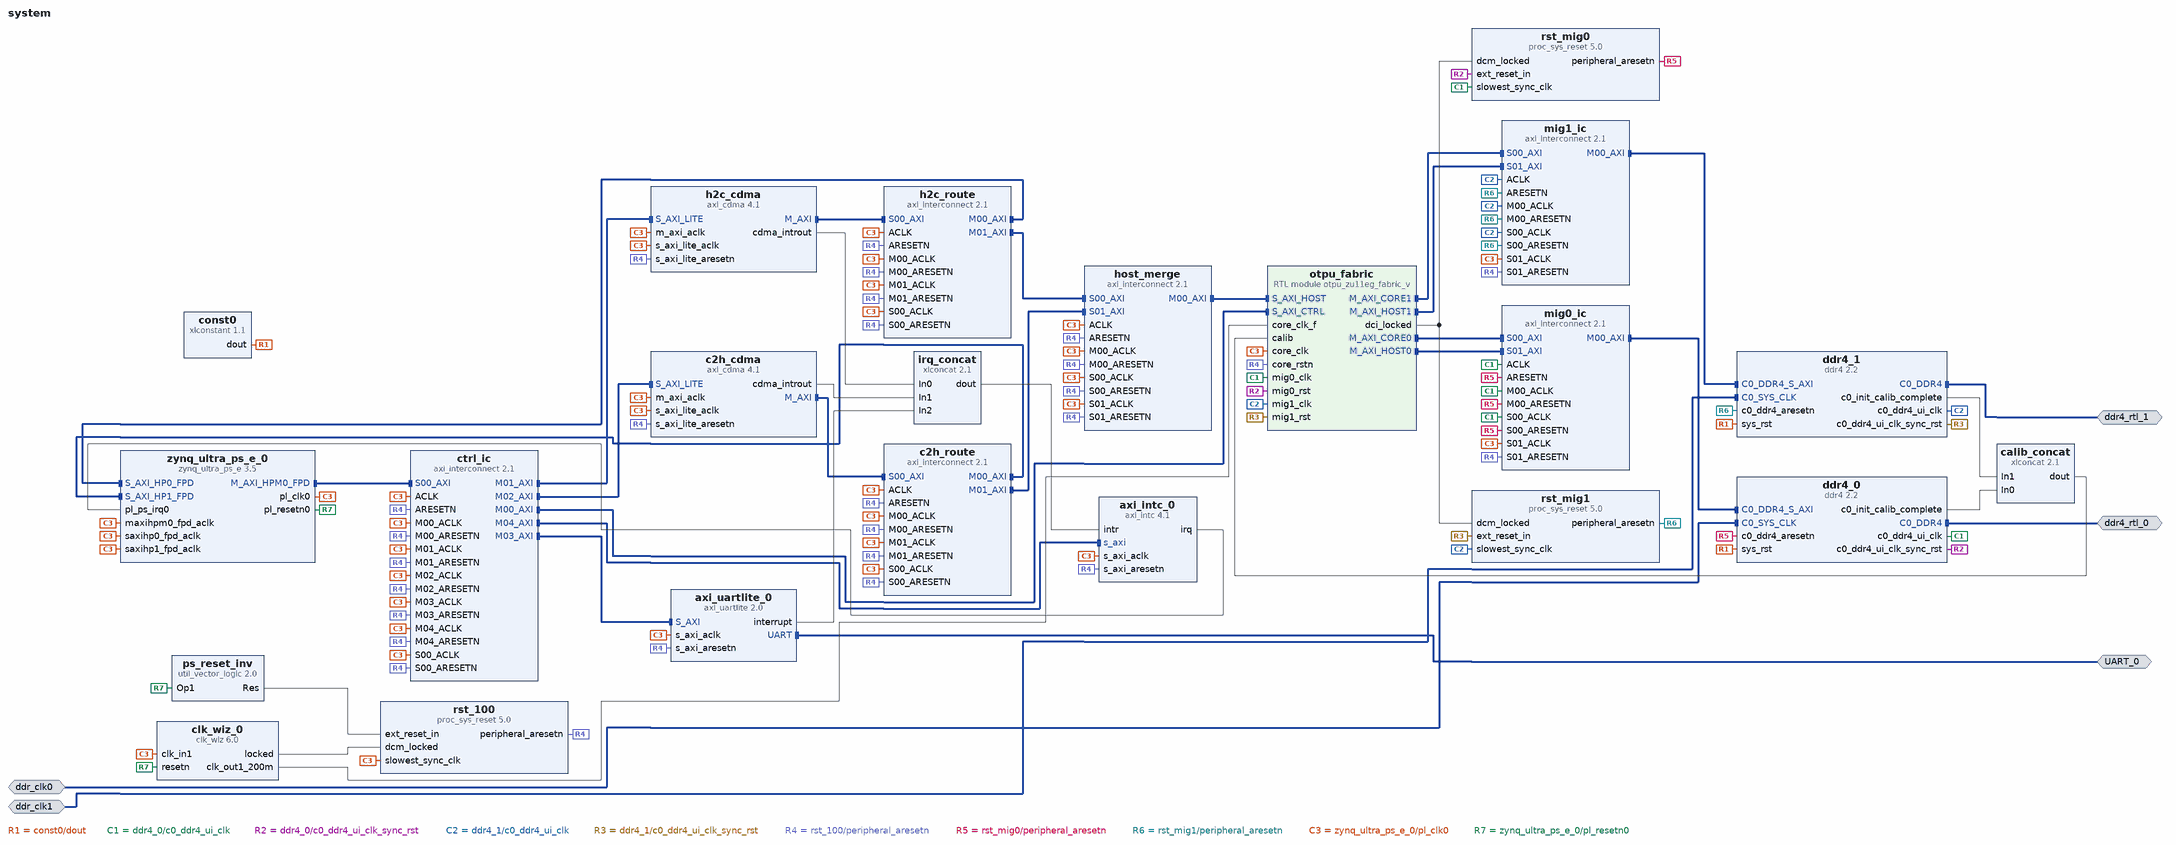
[diagram p0: block diagram of the top level]
# Vivado block design system, xczu11eg-ffvc1760-2-i, Vivado 2025.2
create_bd_design system

create_bd_intf_port -mode Slave -vlnv xilinx.com:interface:diff_clock_rtl:1.0 ddr_clk0
set_property -dict {CONFIG.FREQ_HZ 100000000} [get_bd_intf_ports ddr_clk0]
create_bd_intf_port -mode Slave -vlnv xilinx.com:interface:diff_clock_rtl:1.0 ddr_clk1
set_property -dict {CONFIG.FREQ_HZ 100000000} [get_bd_intf_ports ddr_clk1]
create_bd_intf_port -mode Master -vlnv xilinx.com:interface:ddr4_rtl:1.0 ddr4_rtl_0
create_bd_intf_port -mode Master -vlnv xilinx.com:interface:ddr4_rtl:1.0 ddr4_rtl_1
create_bd_intf_port -mode Master -vlnv xilinx.com:interface:uart_rtl:1.0 UART_0

create_bd_cell -type ip -vlnv xilinx.com:ip:zynq_ultra_ps_e:3.5 zynq_ultra_ps_e_0
set_property -dict [list \
  CONFIG.PSU__CRF_APB__DDR_CTRL__FREQMHZ 1200 \
  CONFIG.PSU__CRL_APB__GEM3_REF_CTRL__FREQMHZ 125 \
  CONFIG.PSU__CRL_APB__GEM3_REF_CTRL__SRCSEL IOPLL \
  CONFIG.PSU__CRL_APB__PL0_REF_CTRL__FREQMHZ 100 \
  CONFIG.PSU__CRL_APB__PL0_REF_CTRL__SRCSEL IOPLL \
  CONFIG.PSU__DDRC__BUS_WIDTH {64 Bit} \
  CONFIG.PSU__DDRC__DEVICE_CAPACITY {16384 MBits} \
  CONFIG.PSU__DDRC__DRAM_WIDTH {16 Bits} \
  CONFIG.PSU__DDRC__ECC Disabled \
  CONFIG.PSU__DDRC__MEMORY_TYPE {DDR 4} \
  CONFIG.PSU__DDRC__SPEED_BIN DDR4_2400T \
  CONFIG.PSU__DDR_HIGH_ADDRESS_GUI_ENABLE 1 \
  CONFIG.PSU__DDR__INTERFACE__FREQMHZ 600.000 \
  CONFIG.PSU__DLL__ISUSED 1 \
  CONFIG.PSU__ENET3__FIFO__ENABLE 0 \
  CONFIG.PSU__ENET3__GRP_MDIO__ENABLE 1 \
  CONFIG.PSU__ENET3__GRP_MDIO__IO {MIO 76 .. 77} \
  CONFIG.PSU__ENET3__PERIPHERAL__ENABLE 1 \
  CONFIG.PSU__ENET3__PERIPHERAL__IO {MIO 64 .. 75} \
  CONFIG.PSU__ENET3__PTP__ENABLE 0 \
  CONFIG.PSU__ENET3__TSU__ENABLE 0 \
  CONFIG.PSU__FPGA_PL0_ENABLE 1 \
  CONFIG.PSU__GEM3_COHERENCY 0 \
  CONFIG.PSU__GEM3_ROUTE_THROUGH_FPD 0 \
  CONFIG.PSU__GEM__TSU__ENABLE 0 \
  CONFIG.PSU__MAXIGP0__DATA_WIDTH 128 \
  CONFIG.PSU__PSS_REF_CLK__FREQMHZ 33.333333 \
  CONFIG.PSU__QSPI_COHERENCY 0 \
  CONFIG.PSU__QSPI_ROUTE_THROUGH_FPD 0 \
  CONFIG.PSU__QSPI__GRP_FBCLK__ENABLE 1 \
  CONFIG.PSU__QSPI__GRP_FBCLK__IO {MIO 6} \
  CONFIG.PSU__QSPI__PERIPHERAL__DATA_MODE x4 \
  CONFIG.PSU__QSPI__PERIPHERAL__ENABLE 1 \
  CONFIG.PSU__QSPI__PERIPHERAL__IO {MIO 0 .. 12} \
  CONFIG.PSU__QSPI__PERIPHERAL__MODE {Dual Parallel} \
  CONFIG.PSU__SD1_COHERENCY 0 \
  CONFIG.PSU__SD1_ROUTE_THROUGH_FPD 0 \
  CONFIG.PSU__SD1__CLK_200_SDR_OTAP_DLY 0x3 \
  CONFIG.PSU__SD1__CLK_50_DDR_ITAP_DLY 0x12 \
  CONFIG.PSU__SD1__CLK_50_DDR_OTAP_DLY 0x6 \
  CONFIG.PSU__SD1__CLK_50_SDR_ITAP_DLY 0x15 \
  CONFIG.PSU__SD1__CLK_50_SDR_OTAP_DLY 0x6 \
  CONFIG.PSU__SD1__DATA_TRANSFER_MODE 8Bit \
  CONFIG.PSU__SD1__GRP_POW__ENABLE 0 \
  CONFIG.PSU__SD1__PERIPHERAL__ENABLE 1 \
  CONFIG.PSU__SD1__PERIPHERAL__IO {MIO 39 .. 51} \
  CONFIG.PSU__SD1__SLOT_TYPE eMMC \
  CONFIG.PSU__TSU__BUFG_PORT_PAIR 0 \
  CONFIG.PSU__UART0__BAUD_RATE 115200 \
  CONFIG.PSU__UART0__MODEM__ENABLE 0 \
  CONFIG.PSU__UART0__PERIPHERAL__ENABLE 1 \
  CONFIG.PSU__UART0__PERIPHERAL__IO {MIO 34 .. 35} \
  CONFIG.PSU__USE__IRQ0 1 \
  CONFIG.PSU__USE__M_AXI_GP0 1 \
  CONFIG.PSU__USE__M_AXI_GP1 0 \
  CONFIG.PSU__USE__M_AXI_GP2 0 \
  CONFIG.PSU__USE__S_AXI_GP2 1 \
  CONFIG.PSU__USE__S_AXI_GP3 1 \
] [get_bd_cells zynq_ultra_ps_e_0]
# 54 more settings of zynq_ultra_ps_e_0 are not shown: defaults, MIO pin electricals, DDR timing, and values the tool derives
create_bd_cell -type ip -vlnv xilinx.com:ip:ddr4:2.2 ddr4_0
set_property -dict [list \
  CONFIG.C0.DDR4_AxiAddressWidth 32 \
  CONFIG.C0.DDR4_AxiDataWidth 512 \
  CONFIG.C0.DDR4_AxiIDWidth 4 \
  CONFIG.C0.DDR4_CasLatency 16 \
  CONFIG.C0.DDR4_CasWriteLatency 12 \
  CONFIG.C0.DDR4_DataWidth 64 \
  CONFIG.C0.DDR4_InputClockPeriod 9996 \
  CONFIG.C0.DDR4_MemoryPart MT40A512M16HA-083E \
  CONFIG.C0.DDR4_TimePeriod 833 \
] [get_bd_cells ddr4_0]
create_bd_cell -type ip -vlnv xilinx.com:ip:ddr4:2.2 ddr4_1
set_property -dict [list \
  CONFIG.C0.DDR4_AxiAddressWidth 32 \
  CONFIG.C0.DDR4_AxiDataWidth 512 \
  CONFIG.C0.DDR4_AxiIDWidth 4 \
  CONFIG.C0.DDR4_CasLatency 16 \
  CONFIG.C0.DDR4_CasWriteLatency 12 \
  CONFIG.C0.DDR4_DataWidth 64 \
  CONFIG.C0.DDR4_InputClockPeriod 9996 \
  CONFIG.C0.DDR4_MemoryPart MT40A512M16HA-083E \
  CONFIG.C0.DDR4_TimePeriod 833 \
] [get_bd_cells ddr4_1]
create_bd_cell -type module -reference otpu_zu11eg_fabric_v otpu_fabric
create_bd_cell -type ip -vlnv xilinx.com:ip:axi_cdma:4.1 h2c_cdma
set_property -dict [list \
  CONFIG.C_ADDR_WIDTH 64 \
  CONFIG.C_INCLUDE_SG 0 \
  CONFIG.C_M_AXI_DATA_WIDTH 128 \
  CONFIG.C_M_AXI_MAX_BURST_LEN 256 \
] [get_bd_cells h2c_cdma]
create_bd_cell -type ip -vlnv xilinx.com:ip:axi_cdma:4.1 c2h_cdma
set_property -dict [list \
  CONFIG.C_ADDR_WIDTH 64 \
  CONFIG.C_INCLUDE_SG 0 \
  CONFIG.C_M_AXI_DATA_WIDTH 128 \
  CONFIG.C_M_AXI_MAX_BURST_LEN 256 \
] [get_bd_cells c2h_cdma]
create_bd_cell -type ip -vlnv xilinx.com:ip:axi_uartlite:2.0 axi_uartlite_0
set_property -dict [list \
  CONFIG.C_BAUDRATE 115200 \
  CONFIG.C_DATA_BITS 8 \
  CONFIG.C_S_AXI_ACLK_FREQ_HZ 100000000 \
  CONFIG.C_USE_PARITY 0 \
] [get_bd_cells axi_uartlite_0]
create_bd_cell -type ip -vlnv xilinx.com:ip:clk_wiz:6.0 clk_wiz_0
set_property -dict [list \
  CONFIG.CLKIN1_JITTER_PS 100.0 \
  CONFIG.CLKOUT1_REQUESTED_OUT_FREQ 200.000 \
  CONFIG.CLKOUT1_REQUESTED_PHASE 0.000 \
  CONFIG.CLKOUT1_USED true \
  CONFIG.CLKOUT2_USED false \
  CONFIG.CLKOUT3_USED false \
  CONFIG.CLKOUT4_USED false \
  CONFIG.CLKOUT5_USED false \
  CONFIG.CLKOUT6_USED false \
  CONFIG.CLKOUT7_USED false \
  CONFIG.CLK_OUT1_PORT clk_out1_200m \
  CONFIG.NUM_OUT_CLKS 1 \
  CONFIG.PRIMITIVE MMCM \
  CONFIG.PRIM_IN_FREQ 100.000 \
  CONFIG.PRIM_SOURCE Global_buffer \
  CONFIG.RESET_PORT resetn \
  CONFIG.RESET_TYPE ACTIVE_LOW \
  CONFIG.USE_LOCKED true \
  CONFIG.USE_RESET true \
] [get_bd_cells clk_wiz_0]
create_bd_cell -type ip -vlnv xilinx.com:ip:axi_intc:4.1 axi_intc_0
set_property -dict {CONFIG.C_IRQ_CONNECTION 1} [get_bd_cells axi_intc_0]
create_bd_cell -type ip -vlnv xilinx.com:ip:xlconcat:2.1 irq_concat
set_property -dict {CONFIG.NUM_PORTS 3} [get_bd_cells irq_concat]
create_bd_cell -type ip -vlnv xilinx.com:ip:axi_interconnect:2.1 ctrl_ic
set_property -dict {CONFIG.NUM_MI 5 CONFIG.NUM_SI 1} [get_bd_cells ctrl_ic]
create_bd_cell -type ip -vlnv xilinx.com:ip:axi_interconnect:2.1 h2c_route
set_property -dict {CONFIG.NUM_MI 2 CONFIG.NUM_SI 1} [get_bd_cells h2c_route]
create_bd_cell -type ip -vlnv xilinx.com:ip:axi_interconnect:2.1 c2h_route
set_property -dict {CONFIG.NUM_MI 2 CONFIG.NUM_SI 1} [get_bd_cells c2h_route]
create_bd_cell -type ip -vlnv xilinx.com:ip:axi_interconnect:2.1 host_merge
set_property -dict {CONFIG.NUM_MI 1 CONFIG.NUM_SI 2} [get_bd_cells host_merge]
create_bd_cell -type ip -vlnv xilinx.com:ip:axi_interconnect:2.1 mig0_ic
set_property -dict [list \
  CONFIG.M00_HAS_DATA_FIFO 2 \
  CONFIG.NUM_MI 1 \
  CONFIG.NUM_SI 2 \
  CONFIG.S00_HAS_DATA_FIFO 2 \
  CONFIG.S01_HAS_DATA_FIFO 2 \
] [get_bd_cells mig0_ic]
create_bd_cell -type ip -vlnv xilinx.com:ip:axi_interconnect:2.1 mig1_ic
set_property -dict [list \
  CONFIG.M00_HAS_DATA_FIFO 2 \
  CONFIG.NUM_MI 1 \
  CONFIG.NUM_SI 2 \
  CONFIG.S00_HAS_DATA_FIFO 2 \
  CONFIG.S01_HAS_DATA_FIFO 2 \
] [get_bd_cells mig1_ic]
create_bd_cell -type ip -vlnv xilinx.com:ip:proc_sys_reset:5.0 rst_100
create_bd_cell -type ip -vlnv xilinx.com:ip:proc_sys_reset:5.0 rst_mig0
create_bd_cell -type ip -vlnv xilinx.com:ip:proc_sys_reset:5.0 rst_mig1
create_bd_cell -type ip -vlnv xilinx.com:ip:util_vector_logic:2.0 ps_reset_inv
set_property -dict {CONFIG.C_OPERATION not CONFIG.C_SIZE 1} [get_bd_cells ps_reset_inv]
create_bd_cell -type ip -vlnv xilinx.com:ip:xlconstant:1.1 const0
set_property -dict {CONFIG.CONST_VAL 0} [get_bd_cells const0]
create_bd_cell -type ip -vlnv xilinx.com:ip:xlconcat:2.1 calib_concat
set_property -dict {CONFIG.NUM_PORTS 2} [get_bd_cells calib_concat]

# ---- connections ----

connect_bd_intf_net [get_bd_intf_ports UART_0] [get_bd_intf_pins axi_uartlite_0/UART]
connect_bd_intf_net [get_bd_intf_pins c2h_cdma/M_AXI] [get_bd_intf_pins c2h_route/S00_AXI]
connect_bd_intf_net [get_bd_intf_pins c2h_route/M00_AXI] [get_bd_intf_pins zynq_ultra_ps_e_0/S_AXI_HP1_FPD]
connect_bd_intf_net [get_bd_intf_pins c2h_route/M01_AXI] [get_bd_intf_pins host_merge/S01_AXI]
connect_bd_intf_net [get_bd_intf_pins ctrl_ic/M00_AXI] [get_bd_intf_pins otpu_fabric/S_AXI_CTRL]
connect_bd_intf_net [get_bd_intf_pins ctrl_ic/M01_AXI] [get_bd_intf_pins h2c_cdma/S_AXI_LITE]
connect_bd_intf_net [get_bd_intf_pins ctrl_ic/M02_AXI] [get_bd_intf_pins c2h_cdma/S_AXI_LITE]
connect_bd_intf_net [get_bd_intf_pins ctrl_ic/M03_AXI] [get_bd_intf_pins axi_uartlite_0/S_AXI]
connect_bd_intf_net [get_bd_intf_pins ctrl_ic/M04_AXI] [get_bd_intf_pins axi_intc_0/s_axi]
connect_bd_intf_net [get_bd_intf_ports ddr4_rtl_0] [get_bd_intf_pins ddr4_0/C0_DDR4]
connect_bd_intf_net [get_bd_intf_ports ddr4_rtl_1] [get_bd_intf_pins ddr4_1/C0_DDR4]
connect_bd_intf_net -intf_net ddr_clk0_1 [get_bd_intf_ports ddr_clk0] [get_bd_intf_pins ddr4_0/C0_SYS_CLK]
connect_bd_intf_net -intf_net ddr_clk1_1 [get_bd_intf_ports ddr_clk1] [get_bd_intf_pins ddr4_1/C0_SYS_CLK]
connect_bd_intf_net [get_bd_intf_pins h2c_cdma/M_AXI] [get_bd_intf_pins h2c_route/S00_AXI]
connect_bd_intf_net [get_bd_intf_pins h2c_route/M00_AXI] [get_bd_intf_pins zynq_ultra_ps_e_0/S_AXI_HP0_FPD]
connect_bd_intf_net [get_bd_intf_pins h2c_route/M01_AXI] [get_bd_intf_pins host_merge/S00_AXI]
connect_bd_intf_net [get_bd_intf_pins host_merge/M00_AXI] [get_bd_intf_pins otpu_fabric/S_AXI_HOST]
connect_bd_intf_net [get_bd_intf_pins mig0_ic/M00_AXI] [get_bd_intf_pins ddr4_0/C0_DDR4_S_AXI]
connect_bd_intf_net [get_bd_intf_pins mig1_ic/M00_AXI] [get_bd_intf_pins ddr4_1/C0_DDR4_S_AXI]
connect_bd_intf_net [get_bd_intf_pins otpu_fabric/M_AXI_CORE0] [get_bd_intf_pins mig0_ic/S00_AXI]
connect_bd_intf_net [get_bd_intf_pins otpu_fabric/M_AXI_CORE1] [get_bd_intf_pins mig1_ic/S00_AXI]
connect_bd_intf_net [get_bd_intf_pins otpu_fabric/M_AXI_HOST0] [get_bd_intf_pins mig0_ic/S01_AXI]
connect_bd_intf_net [get_bd_intf_pins otpu_fabric/M_AXI_HOST1] [get_bd_intf_pins mig1_ic/S01_AXI]
connect_bd_intf_net [get_bd_intf_pins zynq_ultra_ps_e_0/M_AXI_HPM0_FPD] [get_bd_intf_pins ctrl_ic/S00_AXI]
connect_bd_net [get_bd_pins axi_intc_0/irq] [get_bd_pins zynq_ultra_ps_e_0/pl_ps_irq0]
connect_bd_net [get_bd_pins axi_uartlite_0/interrupt] [get_bd_pins irq_concat/In2]
connect_bd_net [get_bd_pins c2h_cdma/cdma_introut] [get_bd_pins irq_concat/In1]
connect_bd_net [get_bd_pins calib_concat/dout] [get_bd_pins otpu_fabric/calib]
connect_bd_net [get_bd_pins clk_wiz_0/clk_out1_200m] [get_bd_pins otpu_fabric/core_clk_f]
connect_bd_net [get_bd_pins clk_wiz_0/locked] [get_bd_pins rst_100/dcm_locked]
connect_bd_net [get_bd_pins const0/dout] [get_bd_pins ddr4_0/sys_rst] [get_bd_pins ddr4_1/sys_rst]
connect_bd_net [get_bd_pins ddr4_0/c0_ddr4_ui_clk] \
  [get_bd_pins otpu_fabric/mig0_clk] [get_bd_pins rst_mig0/slowest_sync_clk] [get_bd_pins mig0_ic/ACLK] \
  [get_bd_pins mig0_ic/S00_ACLK] [get_bd_pins mig0_ic/M00_ACLK]
connect_bd_net [get_bd_pins ddr4_0/c0_ddr4_ui_clk_sync_rst] [get_bd_pins rst_mig0/ext_reset_in] [get_bd_pins otpu_fabric/mig0_rst]
connect_bd_net [get_bd_pins ddr4_0/c0_init_calib_complete] [get_bd_pins calib_concat/In0]
connect_bd_net [get_bd_pins ddr4_1/c0_ddr4_ui_clk] \
  [get_bd_pins otpu_fabric/mig1_clk] [get_bd_pins rst_mig1/slowest_sync_clk] [get_bd_pins mig1_ic/ACLK] \
  [get_bd_pins mig1_ic/S00_ACLK] [get_bd_pins mig1_ic/M00_ACLK]
connect_bd_net [get_bd_pins ddr4_1/c0_ddr4_ui_clk_sync_rst] [get_bd_pins rst_mig1/ext_reset_in] [get_bd_pins otpu_fabric/mig1_rst]
connect_bd_net [get_bd_pins ddr4_1/c0_init_calib_complete] [get_bd_pins calib_concat/In1]
connect_bd_net [get_bd_pins h2c_cdma/cdma_introut] [get_bd_pins irq_concat/In0]
connect_bd_net [get_bd_pins irq_concat/dout] [get_bd_pins axi_intc_0/intr]
connect_bd_net [get_bd_pins otpu_fabric/dci_locked] [get_bd_pins rst_mig0/dcm_locked] [get_bd_pins rst_mig1/dcm_locked]
connect_bd_net [get_bd_pins ps_reset_inv/Res] [get_bd_pins rst_100/ext_reset_in]
connect_bd_net [get_bd_pins rst_100/peripheral_aresetn] \
  [get_bd_pins otpu_fabric/core_rstn] [get_bd_pins h2c_cdma/s_axi_lite_aresetn] [get_bd_pins c2h_cdma/s_axi_lite_aresetn] \
  [get_bd_pins axi_uartlite_0/s_axi_aresetn] [get_bd_pins axi_intc_0/s_axi_aresetn] [get_bd_pins ctrl_ic/ARESETN] \
  [get_bd_pins ctrl_ic/S00_ARESETN] [get_bd_pins ctrl_ic/M00_ARESETN] [get_bd_pins ctrl_ic/M01_ARESETN] \
  [get_bd_pins ctrl_ic/M02_ARESETN] [get_bd_pins ctrl_ic/M03_ARESETN] [get_bd_pins ctrl_ic/M04_ARESETN] \
  [get_bd_pins h2c_route/ARESETN] [get_bd_pins h2c_route/S00_ARESETN] [get_bd_pins h2c_route/M00_ARESETN] \
  [get_bd_pins h2c_route/M01_ARESETN] [get_bd_pins c2h_route/ARESETN] [get_bd_pins c2h_route/S00_ARESETN] \
  [get_bd_pins c2h_route/M00_ARESETN] [get_bd_pins c2h_route/M01_ARESETN] [get_bd_pins host_merge/ARESETN] \
  [get_bd_pins host_merge/S00_ARESETN] [get_bd_pins host_merge/S01_ARESETN] [get_bd_pins host_merge/M00_ARESETN] \
  [get_bd_pins mig0_ic/S01_ARESETN] [get_bd_pins mig1_ic/S01_ARESETN]
connect_bd_net [get_bd_pins rst_mig0/peripheral_aresetn] \
  [get_bd_pins ddr4_0/c0_ddr4_aresetn] [get_bd_pins mig0_ic/ARESETN] [get_bd_pins mig0_ic/S00_ARESETN] \
  [get_bd_pins mig0_ic/M00_ARESETN]
connect_bd_net [get_bd_pins rst_mig1/peripheral_aresetn] \
  [get_bd_pins ddr4_1/c0_ddr4_aresetn] [get_bd_pins mig1_ic/ARESETN] [get_bd_pins mig1_ic/S00_ARESETN] \
  [get_bd_pins mig1_ic/M00_ARESETN]
connect_bd_net [get_bd_pins zynq_ultra_ps_e_0/pl_clk0] \
  [get_bd_pins otpu_fabric/core_clk] [get_bd_pins clk_wiz_0/clk_in1] [get_bd_pins rst_100/slowest_sync_clk] \
  [get_bd_pins h2c_cdma/s_axi_lite_aclk] [get_bd_pins h2c_cdma/m_axi_aclk] [get_bd_pins c2h_cdma/s_axi_lite_aclk] \
  [get_bd_pins c2h_cdma/m_axi_aclk] [get_bd_pins axi_uartlite_0/s_axi_aclk] [get_bd_pins axi_intc_0/s_axi_aclk] \
  [get_bd_pins zynq_ultra_ps_e_0/maxihpm0_fpd_aclk] [get_bd_pins zynq_ultra_ps_e_0/saxihp0_fpd_aclk] \
  [get_bd_pins zynq_ultra_ps_e_0/saxihp1_fpd_aclk] [get_bd_pins ctrl_ic/ACLK] [get_bd_pins ctrl_ic/S00_ACLK] \
  [get_bd_pins ctrl_ic/M00_ACLK] [get_bd_pins ctrl_ic/M01_ACLK] [get_bd_pins ctrl_ic/M02_ACLK] [get_bd_pins ctrl_ic/M03_ACLK] \
  [get_bd_pins ctrl_ic/M04_ACLK] [get_bd_pins h2c_route/ACLK] [get_bd_pins h2c_route/S00_ACLK] \
  [get_bd_pins h2c_route/M00_ACLK] [get_bd_pins h2c_route/M01_ACLK] [get_bd_pins c2h_route/ACLK] \
  [get_bd_pins c2h_route/S00_ACLK] [get_bd_pins c2h_route/M00_ACLK] [get_bd_pins c2h_route/M01_ACLK] \
  [get_bd_pins host_merge/ACLK] [get_bd_pins host_merge/S00_ACLK] [get_bd_pins host_merge/S01_ACLK] \
  [get_bd_pins host_merge/M00_ACLK] [get_bd_pins mig0_ic/S01_ACLK] [get_bd_pins mig1_ic/S01_ACLK]
connect_bd_net [get_bd_pins zynq_ultra_ps_e_0/pl_resetn0] [get_bd_pins clk_wiz_0/resetn] [get_bd_pins ps_reset_inv/Op1]

# ---- address map ----
assign_bd_address -offset 0x0000000000000000 -range 2G -target_address_space [get_bd_addr_spaces c2h_cdma/Data] [get_bd_addr_segs zynq_ultra_ps_e_0/SAXIGP3/HP1_DDR_LOW]
assign_bd_address -offset 0x0000000800000000 -range 4G -target_address_space [get_bd_addr_spaces c2h_cdma/Data] [get_bd_addr_segs otpu_fabric/S_AXI_HOST/reg0]
assign_bd_address -offset 0x0000000000000000 -range 2G -target_address_space [get_bd_addr_spaces h2c_cdma/Data] [get_bd_addr_segs zynq_ultra_ps_e_0/SAXIGP2/HP0_DDR_LOW]
assign_bd_address -offset 0x0000000800000000 -range 4G -target_address_space [get_bd_addr_spaces h2c_cdma/Data] [get_bd_addr_segs otpu_fabric/S_AXI_HOST/reg0]
assign_bd_address -offset 0x00000000 -range 4G -target_address_space [get_bd_addr_spaces otpu_fabric/M_AXI_CORE0] [get_bd_addr_segs ddr4_0/C0_DDR4_MEMORY_MAP/C0_DDR4_ADDRESS_BLOCK]
assign_bd_address -offset 0x00000000 -range 4G -target_address_space [get_bd_addr_spaces otpu_fabric/M_AXI_CORE1] [get_bd_addr_segs ddr4_1/C0_DDR4_MEMORY_MAP/C0_DDR4_ADDRESS_BLOCK]
assign_bd_address -offset 0x00000000 -range 4G -target_address_space [get_bd_addr_spaces otpu_fabric/M_AXI_HOST0] [get_bd_addr_segs ddr4_0/C0_DDR4_MEMORY_MAP/C0_DDR4_ADDRESS_BLOCK]
assign_bd_address -offset 0x00000000 -range 4G -target_address_space [get_bd_addr_spaces otpu_fabric/M_AXI_HOST1] [get_bd_addr_segs ddr4_1/C0_DDR4_MEMORY_MAP/C0_DDR4_ADDRESS_BLOCK]
assign_bd_address -offset 0x00A0000000 -range 64K -target_address_space [get_bd_addr_spaces zynq_ultra_ps_e_0/Data] [get_bd_addr_segs otpu_fabric/S_AXI_CTRL/reg0]
assign_bd_address -offset 0x00A0010000 -range 64K -target_address_space [get_bd_addr_spaces zynq_ultra_ps_e_0/Data] [get_bd_addr_segs h2c_cdma/S_AXI_LITE/Reg]
assign_bd_address -offset 0x00A0020000 -range 64K -target_address_space [get_bd_addr_spaces zynq_ultra_ps_e_0/Data] [get_bd_addr_segs c2h_cdma/S_AXI_LITE/Reg]
assign_bd_address -offset 0x00A0030000 -range 64K -target_address_space [get_bd_addr_spaces zynq_ultra_ps_e_0/Data] [get_bd_addr_segs axi_uartlite_0/S_AXI/Reg]
assign_bd_address -offset 0x00A0040000 -range 64K -target_address_space [get_bd_addr_spaces zynq_ultra_ps_e_0/Data] [get_bd_addr_segs axi_intc_0/S_AXI/Reg]

validate_bd_design
save_bd_design
